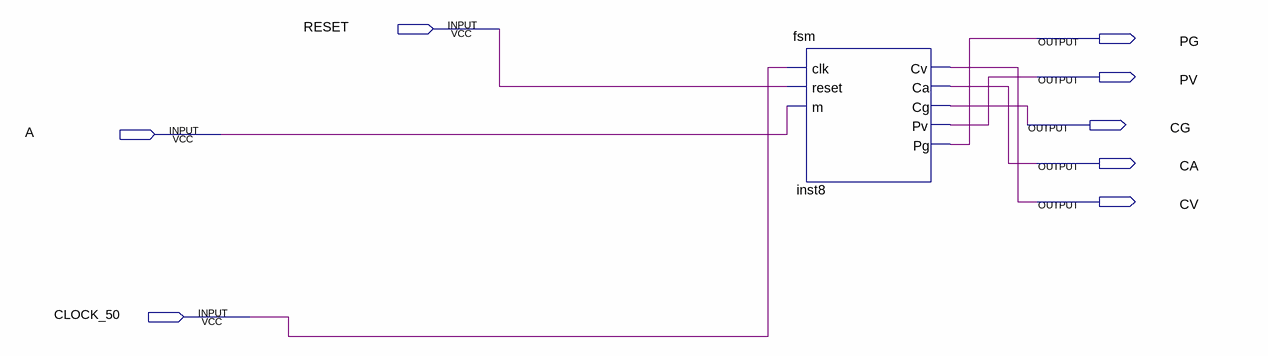
[diagram p0: schematic sheet]
// Quartus schematic exp10.bdf as structural Verilog: 1 symbols, 8 pins
module exp10 (
  input  RESET,
  input  A,
  input  CLOCK_50,
  output PG,
  output PV,
  output CG,
  output CA,
  output CV
);

  fsm inst8 (.clk(CLOCK_50), .reset(RESET), .m(A), .Cv(CV), .Ca(CA), .Cg(CG), .Pv(PV), .Pg(PG));
endmodule
